# Altium schematic sheet 14_Expansion.SchDoc
size 812 x 508 mm; SheetNumber: 14; SheetTotal: 16
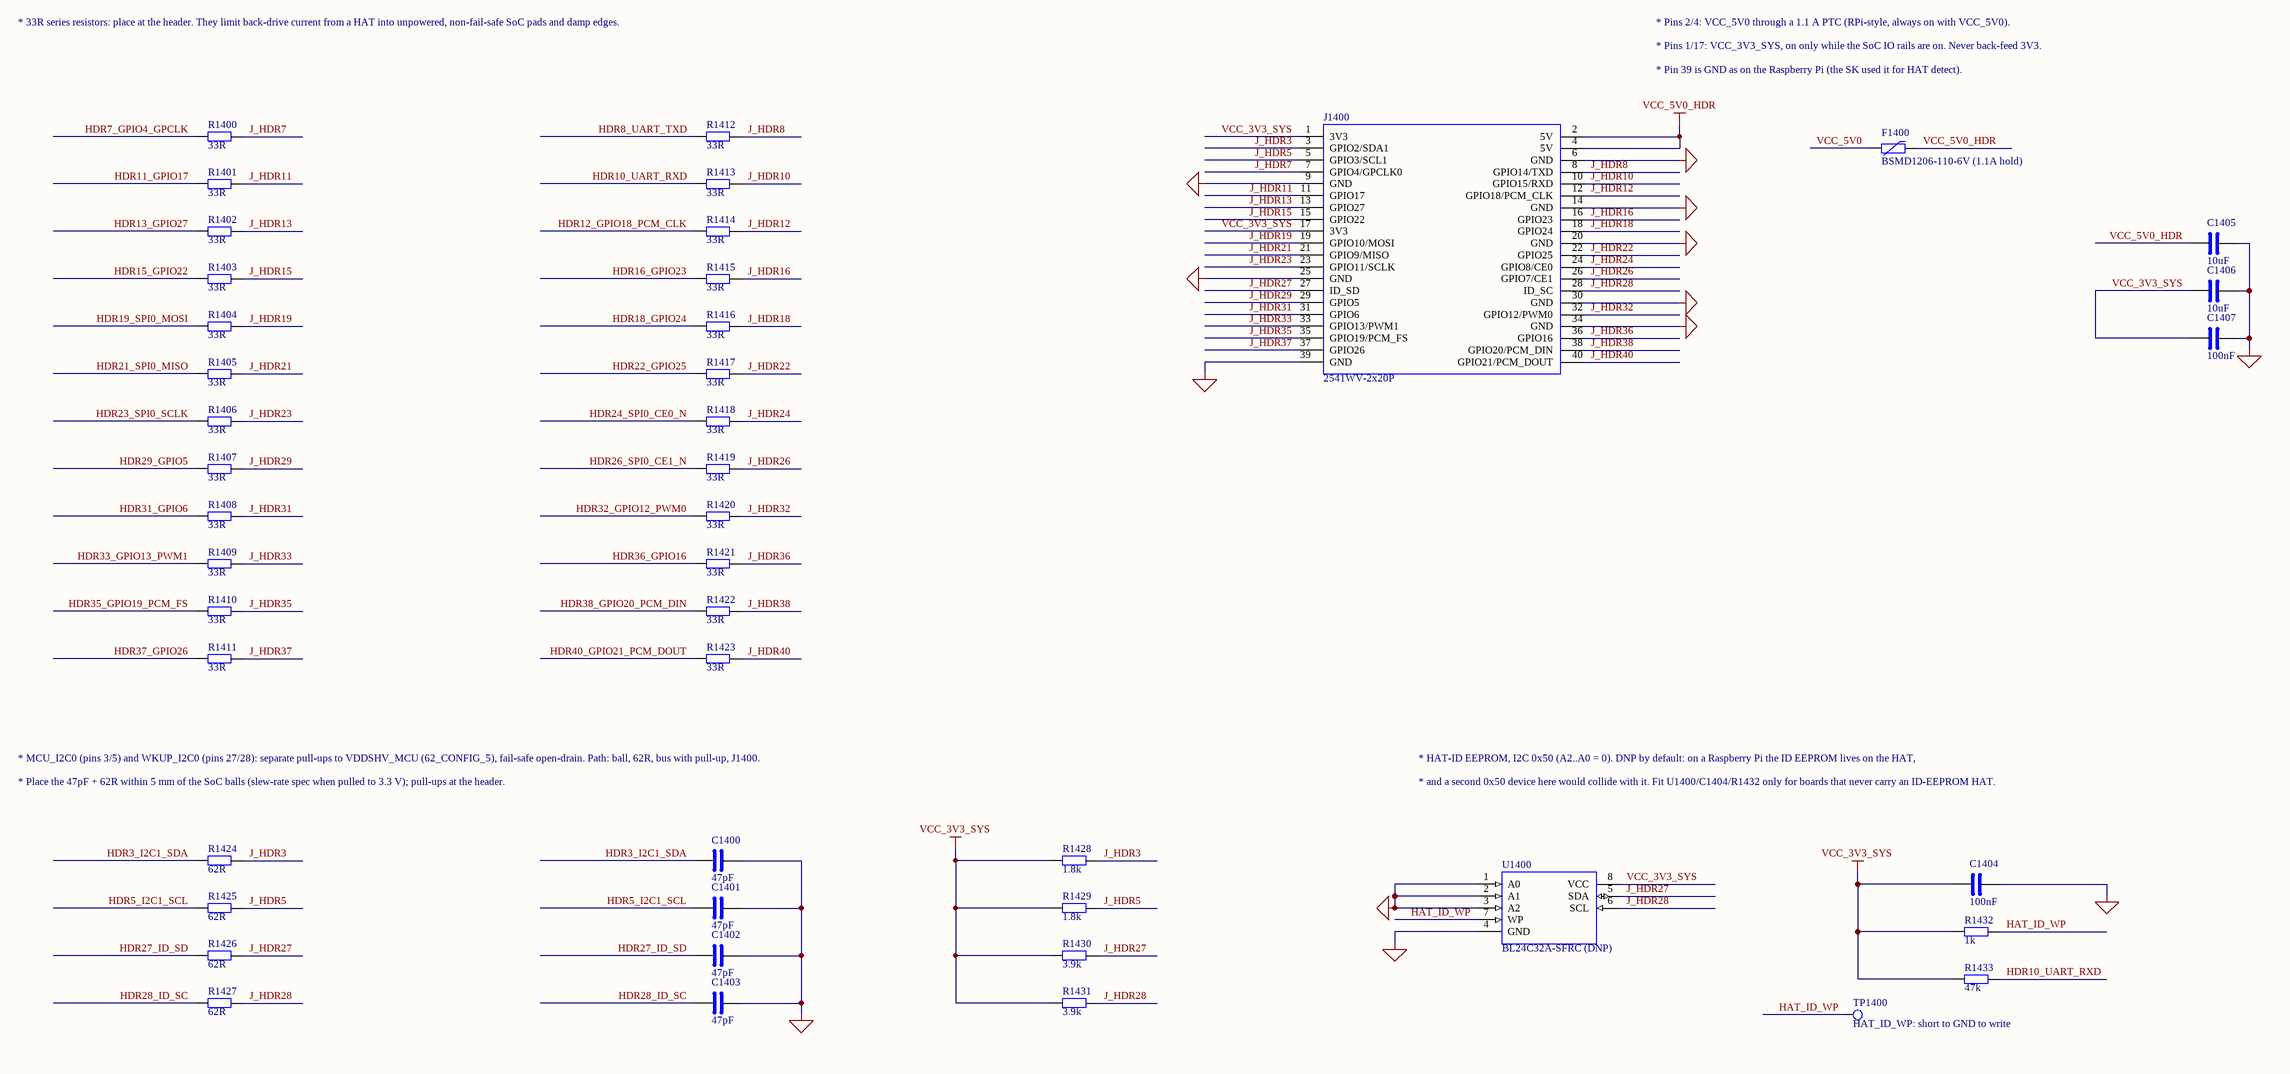
[diagram p0: 14_Expansion.SchDoc]

## Parts
C1400  47pF  [C0402]
C1401  47pF  [C0402]
C1402  47pF  [C0402]
C1403  47pF  [C0402]
C1404  100nF  [C0402]
C1405  10uF  [C0603]
C1406  10uF  [C0603]
C1407  100nF  [C0402]
F1400  BSMD1206-110-6V (1.1A hold)  [FUSE_BHFUSE_BSMD1206]
J1400  2541WV-2x20P  [HDR_2X20_P2.54_THT]
R1400  33R  [R0402]
R1401  33R  [R0402]
R1402  33R  [R0402]
R1403  33R  [R0402]
R1404  33R  [R0402]
R1405  33R  [R0402]
R1406  33R  [R0402]
R1407  33R  [R0402]
R1408  33R  [R0402]
R1409  33R  [R0402]
R1410  33R  [R0402]
R1411  33R  [R0402]
R1412  33R  [R0402]
R1413  33R  [R0402]
R1414  33R  [R0402]
R1415  33R  [R0402]
R1416  33R  [R0402]
R1417  33R  [R0402]
R1418  33R  [R0402]
R1419  33R  [R0402]
R1420  33R  [R0402]
R1421  33R  [R0402]
R1422  33R  [R0402]
R1423  33R  [R0402]
R1424  62R  [R0402]
R1425  62R  [R0402]
R1426  62R  [R0402]
R1427  62R  [R0402]
R1428  1.8k  [R0402]
R1429  1.8k  [R0402]
R1430  3.9k  [R0402]
R1431  3.9k  [R0402]
R1432  1k  [R0402]
R1433  47k  [R0402]
TP1400  HAT_ID_WP: short to GND to write  [TP_PAD_1.0]
U1400  BL24C32A-SFRC (DNP)  [TSSOP8_4.4X3.0_P0.65]

## Nets
GND: C1400.2 C1401.2 C1402.2 C1403.2 C1404.2 C1405.2 C1406.2 C1407.2 J1400.6(GND) J1400.9(GND) J1400.14(GND) J1400.20(GND) J1400.25(GND) J1400.30(GND) J1400.34(GND) J1400.39(GND) U1400.1(A0) U1400.2(A1) U1400.3(A2) U1400.4(GND)
VCC_3V3_SYS: C1404.1 C1406.1 C1407.1 J1400.1(3V3) J1400.17(3V3) R1428.1 R1429.1 R1430.1 R1431.1 R1432.1 R1433.1 U1400.8(VCC)
VCC_5V0_HDR: C1405.1 F1400.2 J1400.2(5V) J1400.4(5V)
HAT_ID_WP: R1432.2 TP1400.1(TP) U1400.7(WP)
HDR3_I2C1_SDA: C1400.1 R1424.1
HDR5_I2C1_SCL: C1401.1 R1425.1
HDR7_GPIO4_GPCLK: R1400.1
HDR8_UART_TXD: R1412.1
HDR10_UART_RXD: R1413.1 R1433.2
HDR11_GPIO17: R1401.1
HDR12_GPIO18_PCM_CLK: R1414.1
HDR13_GPIO27: R1402.1
HDR15_GPIO22: R1403.1
HDR16_GPIO23: R1415.1
HDR18_GPIO24: R1416.1
HDR19_SPI0_MOSI: R1404.1
HDR21_SPI0_MISO: R1405.1
HDR22_GPIO25: R1417.1
HDR23_SPI0_SCLK: R1406.1
HDR24_SPI0_CE0_N: R1418.1
HDR26_SPI0_CE1_N: R1419.1
HDR27_ID_SD: C1402.1 R1426.1
HDR28_ID_SC: C1403.1 R1427.1
HDR29_GPIO5: R1407.1
HDR31_GPIO6: R1408.1
HDR32_GPIO12_PWM0: R1420.1
HDR33_GPIO13_PWM1: R1409.1
HDR35_GPIO19_PCM_FS: R1410.1
HDR36_GPIO16: R1421.1
HDR37_GPIO26: R1411.1
HDR38_GPIO20_PCM_DIN: R1422.1
HDR40_GPIO21_PCM_DOUT: R1423.1
J_HDR3: J1400.3(GPIO2/SDA1) R1424.2 R1428.2
J_HDR5: J1400.5(GPIO3/SCL1) R1425.2 R1429.2
J_HDR7: J1400.7(GPIO4/GPCLK0) R1400.2
J_HDR8: J1400.8(GPIO14/TXD) R1412.2
J_HDR10: J1400.10(GPIO15/RXD) R1413.2
J_HDR11: J1400.11(GPIO17) R1401.2
J_HDR12: J1400.12(GPIO18/PCM_CLK) R1414.2
J_HDR13: J1400.13(GPIO27) R1402.2
J_HDR15: J1400.15(GPIO22) R1403.2
J_HDR16: J1400.16(GPIO23) R1415.2
J_HDR18: J1400.18(GPIO24) R1416.2
J_HDR19: J1400.19(GPIO10/MOSI) R1404.2
J_HDR21: J1400.21(GPIO9/MISO) R1405.2
J_HDR22: J1400.22(GPIO25) R1417.2
J_HDR23: J1400.23(GPIO11/SCLK) R1406.2
J_HDR24: J1400.24(GPIO8/CE0) R1418.2
J_HDR26: J1400.26(GPIO7/CE1) R1419.2
J_HDR27: J1400.27(ID_SD) R1426.2 R1430.2 U1400.5(SDA)
J_HDR28: J1400.28(ID_SC) R1427.2 R1431.2 U1400.6(SCL)
J_HDR29: J1400.29(GPIO5) R1407.2
J_HDR31: J1400.31(GPIO6) R1408.2
J_HDR32: J1400.32(GPIO12/PWM0) R1420.2
J_HDR33: J1400.33(GPIO13/PWM1) R1409.2
J_HDR35: J1400.35(GPIO19/PCM_FS) R1410.2
J_HDR36: J1400.36(GPIO16) R1421.2
J_HDR37: J1400.37(GPIO26) R1411.2
J_HDR38: J1400.38(GPIO20/PCM_DIN) R1422.2
J_HDR40: J1400.40(GPIO21/PCM_DOUT) R1423.2
VCC_5V0: F1400.1

## Notes on the sheet
- * 33R series resistors: place at the header. They limit back-drive current from a HAT into unpowered, non-fail-safe SoC pads and damp edges.
- * Pins 2/4: VCC_5V0 through a 1.1 A PTC (RPi-style, always on with VCC_5V0).
- * Pins 1/17: VCC_3V3_SYS, on only while the SoC IO rails are on. Never back-feed 3V3.
- * Pin 39 is GND as on the Raspberry Pi (the SK used it for HAT detect).
- * MCU_I2C0 (pins 3/5) and WKUP_I2C0 (pins 27/28): separate pull-ups to VDDSHV_MCU (62_CONFIG_5), fail-safe open-drain. Path: ball, 62R, bus with pull-up, J1400.
- * HAT-ID EEPROM, I2C 0x50 (A2..A0 = 0). DNP by default: on a Raspberry Pi the ID EEPROM lives on the HAT,
- * Place the 47pF + 62R within 5 mm of the SoC balls (slew-rate spec when pulled to 3.3 V); pull-ups at the header.
- * and a second 0x50 device here would collide with it. Fit U1400/C1404/R1432 only for boards that never carry an ID-EEPROM HAT.

## Library data of the parts
C1400-C1403 = CAP: Capacitor, non-polarized; MPN: 0402CG470J500NT; Manufacturer: FH; Spec: 47pF 50V C0G 0402 (I2C slew limiter)
C1404 = CAP: Capacitor, non-polarized; DNP: 1; Spec: 100nF 16V X7R 0402 (EEPROM, DNP)
C1405 = CAP: Capacitor, non-polarized; Spec: 10uF 10V X5R 0603 (header 5V)
C1406 = CAP: Capacitor, non-polarized; Spec: 10uF 10V X5R 0603 (header 3V3)
C1407 = CAP: Capacitor, non-polarized; Spec: 100nF 16V X7R 0402 (header 3V3)
F1400 = PTC_BSMD1206: PTC resettable fuse, 1206, not polarized; Manufacturer: BHFUSE; MPN: BSMD1206-110-6V
J1400 = HDR_2X20_2541WV: Pin header 2x20 2.54 mm, Raspberry Pi 40-pin numbering; Manufacturer: HanElectricity; MPN: 2541WV-2x20P
R1400-R1423 = RES: Resistor; MPN: 0402WGF330JTCE; Manufacturer: UNI-ROYAL; Spec: 33R 1% 0402
R1424-R1427 = RES: Resistor; MPN: 0402WGF620JTCE; Manufacturer: UNI-ROYAL; Spec: 62R 1% 0402 (slew limiter)
R1428 R1429 = RES: Resistor; Spec: 1.8k 1% 0402 (RPi I2C1 value)
R1430 R1431 = RES: Resistor; Spec: 3.9k 1% 0402 (HAT ID bus)
R1432 = RES: Resistor; DNP: 1; Spec: 1k 1% 0402 (WP pull-up, DNP)
R1433 = RES: Resistor; Spec: 47k 1% 0402 (UART5 RX idle high, Octavo 62_UART_2)
TP1400 = TESTPOINT: Test point
U1400 = BL24C32A_TSSOP8: BL24C32A 32 Kbit I2C EEPROM (2-byte address), TSSOP-8; Manufacturer: Shanghai Belling; DNP: 1; MPN: BL24C32A-SFRC